# Altium schematic sheet PCL-03.SchDoc
size Tabloid; SheetNumber: 3; SheetTotal: 4
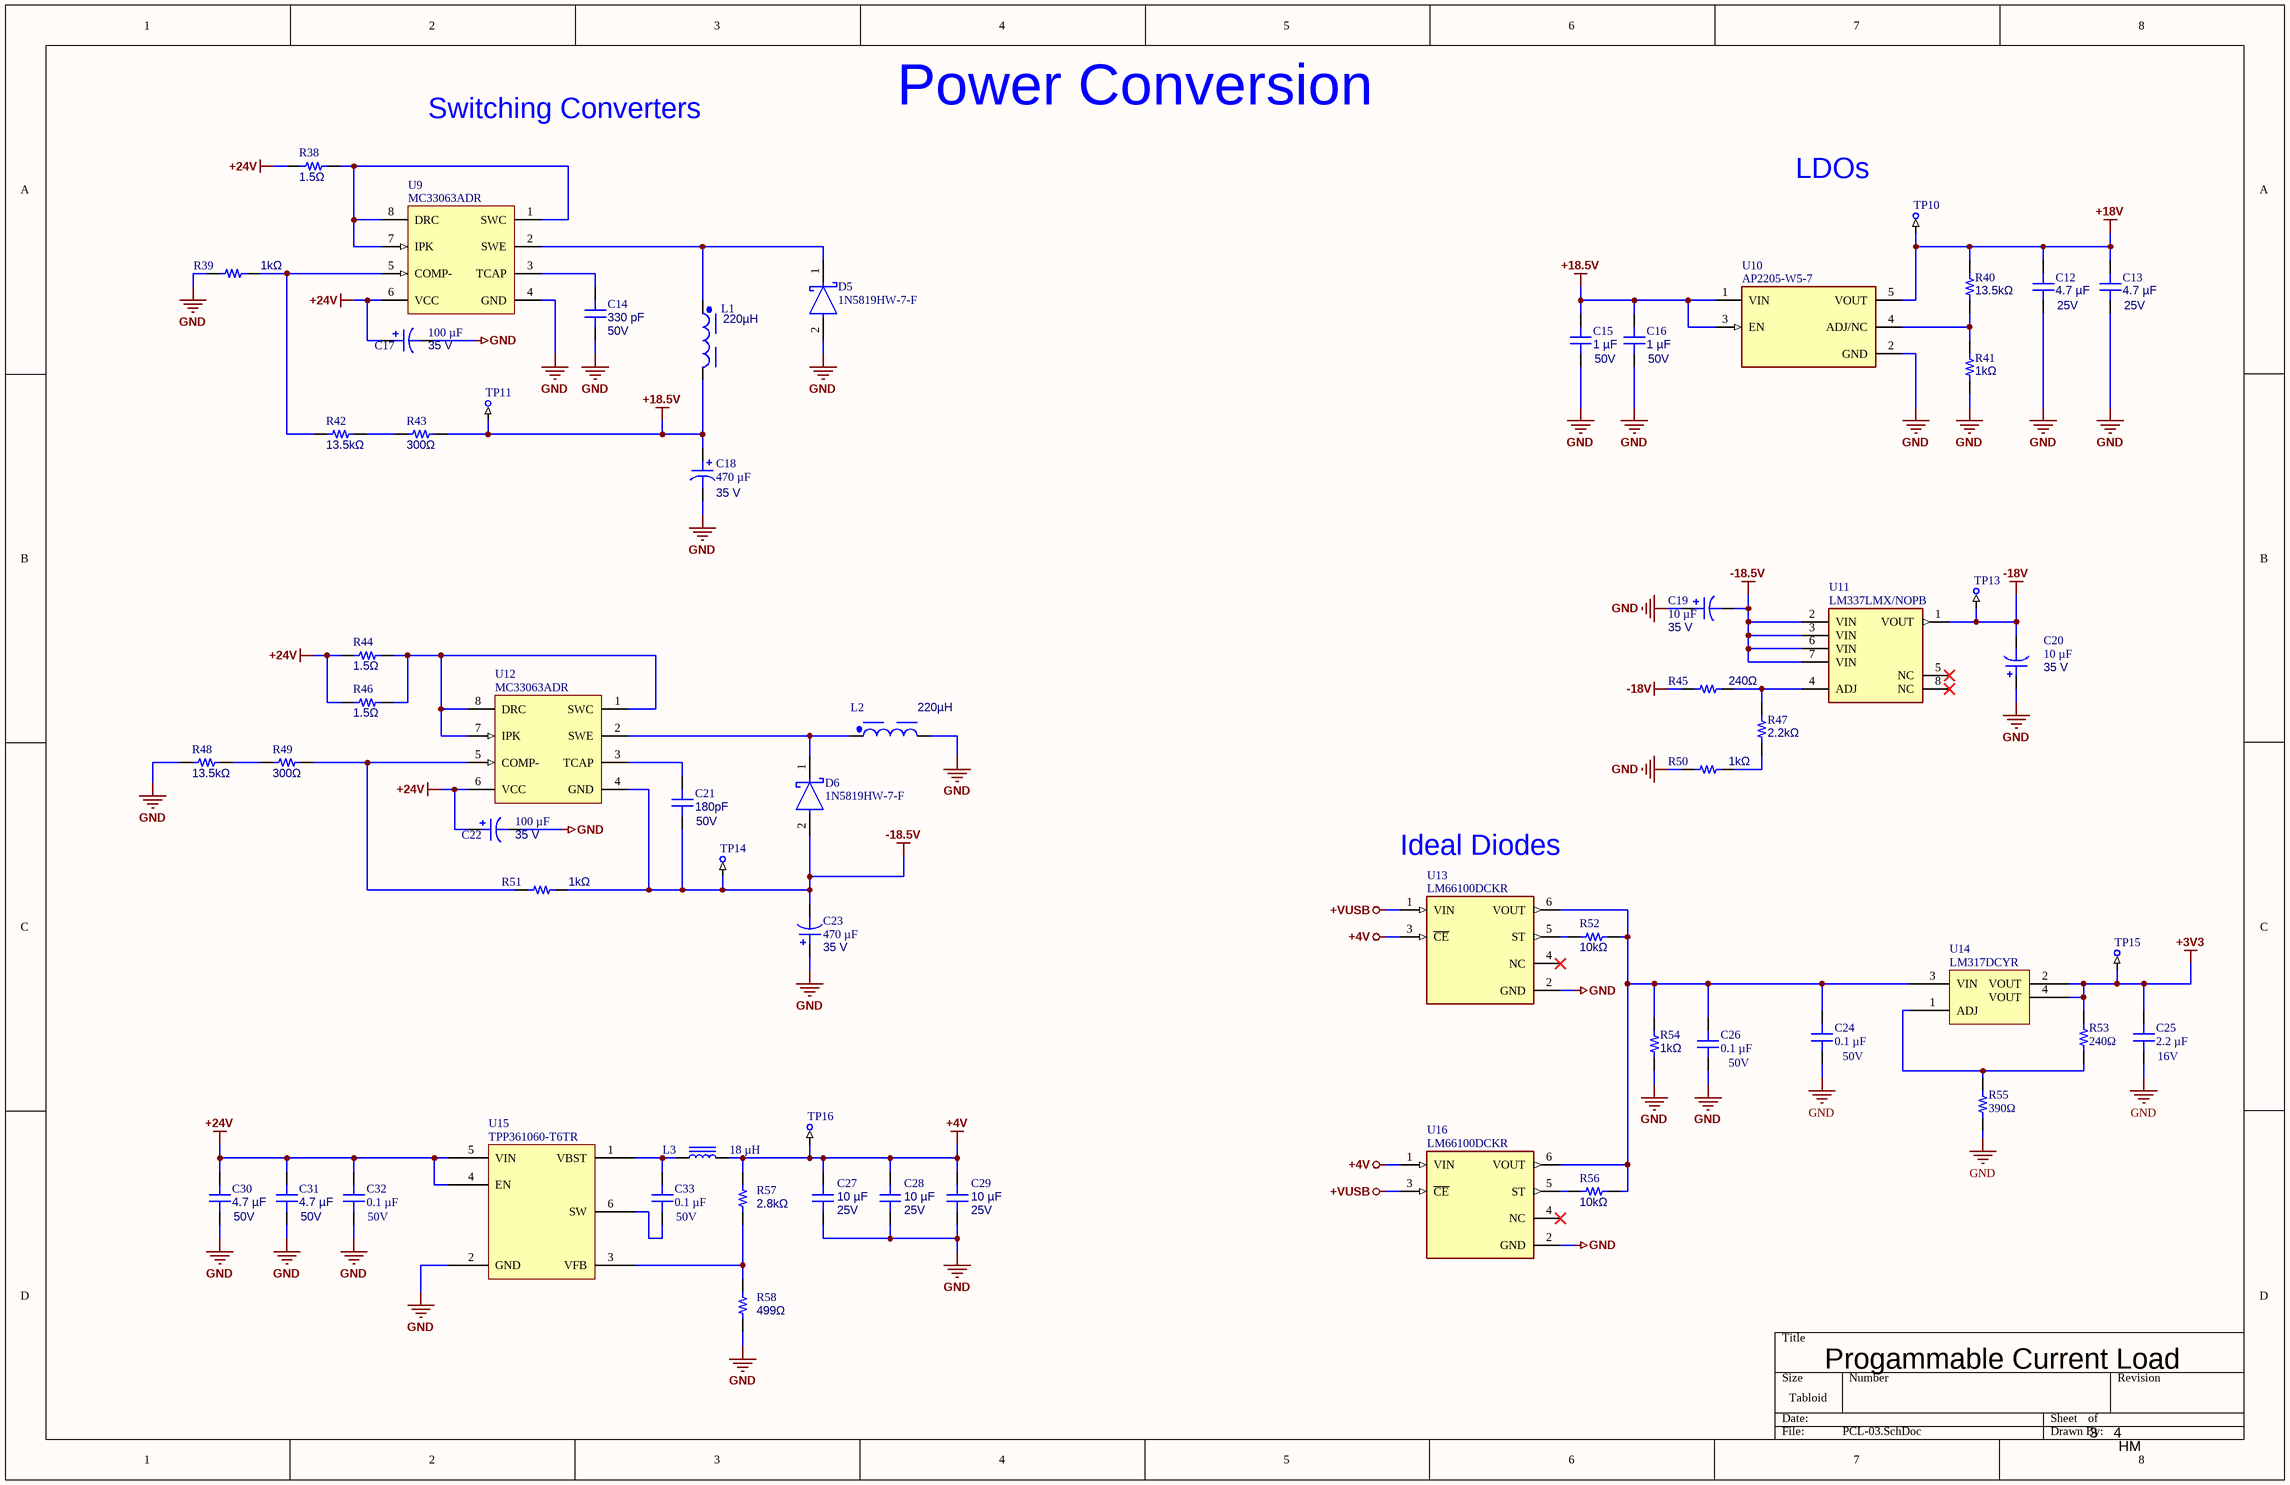
[diagram p0: PCL-03.SchDoc]

## Parts
C12  Voltage - Rated: 25V  [CAP 0805_2012]  (hidden comment: 4.7 µF)
C13  Voltage - Rated: 25V  [CAP 0805_2012]  (hidden comment: 4.7 µF)
C14  Voltage - Rated: 50V  [CAP 0603_1608]  (hidden comment: 330 pF)
C15  Voltage - Rated: 50V  [CAP 0805_2012]  (hidden comment: 1 µF)
C16  Voltage - Rated: 50V  [CAP 0805_2012]  (hidden comment: 1 µF)
C17  100 µF  Voltage - Rated: 35 V  [CAP ALSMD 8.3MM H10.5MM]
C18  470 µF  Voltage - Rated: 35 V  [CAP ALSMD 8.3MM H10.5MM]
C19  10 µF  Voltage - Rated: 35 V  [CAP ALSMD 4.3MM H5.4MM]
C20  10 µF  Voltage - Rated: 35 V  [CAP ALSMD 4.3MM H5.4MM]
C21  Voltage - Rated: 50V  [CAP 0603_1608]  (hidden comment: 180pF)
C22  100 µF  Voltage - Rated: 35 V  [CAP ALSMD 8.3MM H10.5MM]
C23  470 µF  Voltage - Rated: 35 V  [CAP ALSMD 8.3MM H10.5MM]
C24  Voltage - Rated: 50V  [CAP 0603_1608]  (hidden comment: 0.1 µF)
C25  Voltage - Rated: 16V  [CAP 0603_1608]  (hidden comment: 2.2 µF)
C26  Voltage - Rated: 50V  [CAP 0603_1608]  (hidden comment: 0.1 µF)
C27  Voltage - Rated: 25V  [CAP 0805_2012]  (hidden comment: 10 µF)
C28  Voltage - Rated: 25V  [CAP 0805_2012]  (hidden comment: 10 µF)
C29  Voltage - Rated: 25V  [CAP 0805_2012]  (hidden comment: 10 µF)
C30  Voltage - Rated: 50V  [CAP 1206_3216 - 0.8MM]  (hidden comment: 4.7 µF)
C31  Voltage - Rated: 50V  [CAP 1206_3216 - 0.8MM]  (hidden comment: 4.7 µF)
C32  Voltage - Rated: 50V  [CAP 0603_1608]  (hidden comment: 0.1 µF)
C33  Voltage - Rated: 50V  [CAP 0603_1608]  (hidden comment: 0.1 µF)
D5  1N5819HW-7-F  [FP-SOD123-IPC_A]
D6  1N5819HW-7-F  [FP-SOD123-IPC_A]
L1  Inductance: 220µH  [WE-PD_1260P]  (hidden comment: 7447706221)
L2  Inductance: 220µH  [WE-PD_1260P]  (hidden comment: 7447706221)
L3  18 µH  [BOURNS SRR6028]
R38  1.5Ω  [RES 0603_1608]
R39  1kΩ  [RES 0603_1608]
R40  13.5kΩ  [RES 0603_1608]
R41  1kΩ  [RES 0603_1608]
R42  13.5kΩ  [RES 0603_1608]
R43  300Ω  [RES 0603_1608]
R44  1.5Ω  [RES 0603_1608]
R45  240Ω  [RES 0603_1608]
R46  1.5Ω  [RES 0603_1608]
R47  2.2kΩ  [RES 0603_1608]
R48  13.5kΩ  [RES 0603_1608]
R49  300Ω  [RES 0603_1608]
R50  1kΩ  [RES 0603_1608]
R51  1kΩ  [RES 0603_1608]
R52  10kΩ  [RES 0603_1608]
R53  240Ω  [RES 0603_1608]
R54  1kΩ  [RES 0603_1608]
R55  390Ω  [RES 0603_1608]
R56  10kΩ  [RES 0603_1608]
R57  2.8kΩ  [RES 0603_1608]
R58  499Ω  [RES 0603_1608]
TP10  5016  [KEYSTONE-5016_V]  (value not drawn)
TP11  5016  [KEYSTONE-5016_V]  (value not drawn)
TP13  5016  [KEYSTONE-5016_V]  (value not drawn)
TP14  5016  [KEYSTONE-5016_V]  (value not drawn)
TP15  5016  [KEYSTONE-5016_V]  (value not drawn)
TP16  5016  [KEYSTONE-5016_V]  (value not drawn)
U9  MC33063ADR  [D0008A_M]
U10  AP2205-W5-7  [FP-SOT25-IPC_B]
U11  LM337LMX/NOPB  [FP-D0008A-MFG]
U12  MC33063ADR  [D0008A_M]
U13  LM66100DCKR  [SOT65P210X110-6N]
U14  LM317DCYR  [TI SOT-223 DCY]
U15  TPP361060-T6TR  [3PEAK TSOT23-6-A T6T]
U16  LM66100DCKR  [SOT65P210X110-6N]

## Nets
+3V3: C25.2 R53.2 TP15.1 U14.2(VOUT) U14.4(VOUT)
+4V: C27.2 C28.2 C29.2 L3.2 R57.2 TP16.1 U13.3(~{CE}) U16.1(VIN)
+18.5V: C15.2 C16.2 C18.1 L1.2 R43.2 TP11.1 U10.1(VIN) U10.3(EN)
+18V: C12.2 C13.2 R40.1 TP10.1 U10.5(VOUT)
+24V: C17.1 C22.1 C30.2 C31.2 C32.2 R38.1 R44.1 R46.1 U9.6(VCC) U12.6(VCC) U15.4(EN) U15.5(VIN)
+VUSB: U13.1(VIN) U16.3(~{CE})
-18.5V: C19.2 C21.1 C23.2 D6.2(A) R51.2 TP14.1 U11.2(VIN) U11.3(VIN) U11.6(VIN) U11.7(VIN) U12.4(GND)
-18V: C20.2 R45.1 TP13.1 U11.1(VOUT)
GND: C12.1 C13.1 C14.2 C15.1 C16.1 C17.2 C18.2 C19.1 C20.1 C22.2 C23.1 C24.1 C25.1 C26.1 C27.1 C28.1 C29.1 C30.1 C31.1 C32.1 D5.2(A) L2.2 R39.1 R41.2 R48.1 R50.1 R54.1 R55.1 R58.1 U9.4(GND) U10.2(GND) U13.2(GND) U15.2(GND) U16.2(GND)
NetC14_1: C14.1 U9.3(TCAP)
NetC21_2: C21.2 U12.3(TCAP)
NetC24_2: C24.2 C26.2 R52.2 R54.2 R56.2 U13.6(VOUT) U14.3(VIN) U16.6(VOUT)
NetC33_1: C33.1 U15.6(SW)
NetC33_2: C33.2 L3.1 U15.1(VBST)
NetD5_1: D5.1(C) L1.1 U9.2(SWE)
NetD6_1: D6.1(C) L2.1 U12.2(SWE)
NetR38_2: R38.2 U9.1(SWC) U9.7(IPK) U9.8(DRC)
NetR39_2: R39.2 R42.1 U9.5(COMP-)
NetR40_2: R40.2 R41.1 U10.4(ADJ/NC)
NetR42_2: R42.2 R43.1
NetR44_2: R44.2 R46.2 U12.1(SWC) U12.7(IPK) U12.8(DRC)
NetR45_2: R45.2 R47.2 U11.4(ADJ)
NetR47_1: R47.1 R50.2
NetR48_2: R48.2 R49.1
NetR49_2: R49.2 R51.1 U12.5(COMP-)
NetR52_1: R52.1 U13.5(ST)
NetR53_1: R53.1 R55.2 U14.1(ADJ)
NetR56_1: R56.1 U16.5(ST)
NetR57_1: R57.1 R58.2 U15.3(VFB)

Not connected (* = marked no-connect by the designer): U11 5(NC)* 8(NC)*; U13 4(NC)*; U16 4(NC)*

## Notes on the sheet
- Switching Converters
- Power Conversion
- LDOs
- Ideal Diodes
- Progammable Current Load
- 3
- 4
- HM

## Library data of the parts
C12 C13 = 0805X475K250CT: CAP CER 4.7UF 25V X5R 0805; manufacturer: Walsin Technology Corporation; Tolerance: ±10%; Part Number: 0805X475K250CT; Capacitance: 4.7 µF; Applications: General Purpose; componentlink1description: Datasheet; componentlink1url: https://www.passivecomponent.com/wp-content/uploads/datasheet/WTC_MLCC_General_Purpose.pdf; componentlink2description: DigiKey Link; componentlink2url: https://www.digikey.com/en/products/detail/walsin-technology-corporation/0805X475K250CT/14836837; Device Package: 0805 (2012 Metric); lastupdated: 2026-04-06 7:32:06 PM; Lifecycle Status: Active; Minimum Order: 1; Mounting Type: Surface Mount, MLCC; Operating Temperature: -55°C ~ 85°C; Package / Case: 0805 (2012 Metric); packaging: TapeAndReel; partid: 33404; Part Status: Active; price: 0.03; series: -; Size / Dimension: 0.079" L x 0.049" W (2.00mm x 1.25mm); Supplier 1: DigiKey; Supplier Part Number 1: 1292-0805X475K250CT-ND; Temperature Coefficient: X5R; Thickness (Max): 0.057" (1.45mm); value: 4.7 µF
C14 = AC0603JRNPO9BN331: CAP CER 330PF 50V C0G/NPO 0603; manufacturer: Yageo; Temperature Coefficient: C0G, NP0; Tolerance: ±5%; Part Number: AC0603JRNPO9BN331; Capacitance: 330 pF; Applications: Automotive; componentlink1description: Datasheet; componentlink1url: http://www.yageo.com/NewPortal/_en/search/productDocs.jsp?YageoPartNumber=AC0603JRNPO9BN331; componentlink2description: DigiKey Link; componentlink2url: https://www.digikey.com/en/products/detail/yageo/AC0603JRNPO9BN331/6643266; Device Package: 0603 (1608 Metric); lastupdated: 2026-04-06 7:23:52 PM; Lifecycle Status: Active; Minimum Order: 1; Mounting Type: Surface Mount, MLCC; Operating Temperature: -55°C ~ 125°C; Package / Case: 0603 (1608 Metric); packaging: TapeAndReel; partid: 2321; Part Status: Active; price: 0.01; Ratings: AEC-Q200; series: AC; Size / Dimension: 0.063" L x 0.031" W (1.60mm x 0.80mm); Supplier 1: DigiKey; Supplier Part Number 1: 311-3280-1-ND; Thickness (Max): 0.035" (0.90mm); value: 330 pF
C15 C16 = 0805B105K500CT: CAP CER 1UF 50V X7R 0805; manufacturer: Walsin Technology Corporation; Tolerance: ±10%; Part Number: 0805B105K500CT; Capacitance: 1 µF; Applications: General Purpose; componentlink1description: Datasheet; componentlink1url: https://www.passivecomponent.com/wp-content/uploads/datasheet/WTC_MLCC_General_Purpose.pdf; componentlink2description: DigiKey Link; componentlink2url: https://www.digikey.com/en/products/detail/walsin-technology-corporation/0805B105K500CT/14836864; Device Package: 0805 (2012 Metric); lastupdated: 2026-04-06 7:31:50 PM; Lifecycle Status: Active; Minimum Order: 1; Mounting Type: Surface Mount, MLCC; Operating Temperature: -55°C ~ 125°C; Package / Case: 0805 (2012 Metric); packaging: TapeAndReel; partid: 41252; Part Status: Active; price: 0.01; series: -; Size / Dimension: 0.079" L x 0.049" W (2.00mm x 1.25mm); Supplier 1: DigiKey; Supplier Part Number 1: 1292-0805B105K500CT-ND; Temperature Coefficient: X7R; Thickness (Max): 0.057" (1.45mm); value: 1 µF
C17 C22 = UCD1V101MNL1GS: CAP ALUM 100UF 20% 35V SMD; manufacturer: Nichicon; Impedance: 160 mOhms; Lifetime @ Temp.: 5000 Hrs @ 105°C; Polarization: Polar; Ripple Current @ High Frequency: 600 mA @ 100 kHz; Ripple Current @ Low Frequency: 300 mA @ 120 Hz; Surface Mount Land Size: 0.327" L x 0.327" W (8.30mm x 8.30mm); Part Number: UCD1V101MNL1GS; Applications: Automotive; Capacitance: 100 µF; componentlink1description: Datasheet; componentlink1url: http://nichicon-us.com/english/products/pdfs/e-ucd.pdf; componentlink2description: DigiKey Link; componentlink2url: https://www.digikey.com/en/products/detail/nichicon/UCD1V101MNL1GS/3439293; Device Package: Radial, Can - SMD; Height - Seated (Max): 0.413" (10.50mm); lastupdated: 2026-04-05 8:53:58 PM; Lifecycle Status: Active; Minimum Order: 1; Mounting Type: Surface Mount; Operating Temperature: -55°C ~ 105°C; Package / Case: Radial, Can - SMD; packaging: TapeAndReel; partid: 7455; Part Status: Active; price: 0.14; Ratings: AEC-Q200; series: UCD; Size / Dimension: 0.315" Dia (8.00mm); Supplier 1: DigiKey; Supplier Part Number 1: 493-6186-1-ND; Tolerance: ±20%; value: 100 µF
C18 C23 = UCV1V471MNL1GS: CAP ALUM 470UF 20% 35V SMD; manufacturer: Nichicon; Impedance: 80 mOhms; Lifetime @ Temp.: 2000 Hrs @ 105°C; Polarization: Polar; Ripple Current @ High Frequency: 850 mA @ 100 kHz; Ripple Current @ Low Frequency: 425 mA @ 120 Hz; Surface Mount Land Size: 0.327" L x 0.327" W (8.30mm x 8.30mm); Part Number: UCV1V471MNL1GS; Applications: General Purpose; Capacitance: 470 µF; componentlink1description: Datasheet; componentlink1url: http://nichicon-us.com/english/products/pdfs/e-ucv.pdf; componentlink2description: DigiKey Link; componentlink2url: https://www.digikey.com/en/products/detail/nichicon/UCV1V471MNL1GS/5724335; Device Package: Radial, Can - SMD; Height - Seated (Max): 0.413" (10.50mm); lastupdated: 2026-04-05 8:53:55 PM; Lifecycle Status: Active; Minimum Order: 1; Mounting Type: Surface Mount; Operating Temperature: -55°C ~ 105°C; Package / Case: Radial, Can - SMD; packaging: TapeAndReel; partid: 27851; Part Status: Active; price: 0.38; Ratings: AEC-Q200; series: UCV; Size / Dimension: 0.315" Dia (8.00mm); Supplier 1: DigiKey; Supplier Part Number 1: 493-14356-1-ND; Tolerance: ±20%; value: 470 µF
C19 C20 = 865080540004: CAP ALUM 10UF 20% 35V SMD; manufacturer: Würth Elektronik; Impedance: 2 Ohms; Lifetime @ Temp.: 2000 Hrs @ 105°C; Polarization: Polar; Ripple Current @ High Frequency: 90 mA @ 100 kHz; Ripple Current @ Low Frequency: 53.1 mA @ 120 Hz; Surface Mount Land Size: 0.169" L x 0.169" W (4.30mm x 4.30mm); Part Number: 865080540004; Applications: General Purpose; Capacitance: 10 µF; componentlink1description: Datasheet; componentlink1url: https://katalog.we-online.de/pbs/datasheet/865080540004.pdf; componentlink2description: DigiKey Link; componentlink2url: https://www.digikey.com/en/products/detail/würth-elektronik/865080540004/5728098; Device Package: Radial, Can - SMD; Height - Seated (Max): 0.217" (5.50mm); lastupdated: 2026-04-05 8:29:50 PM; Lifecycle Status: Active; Minimum Order: 1; Mounting Type: Surface Mount; Operating Temperature: -55°C ~ 105°C; Package / Case: Radial, Can - SMD; packaging: TapeAndReel; partid: 7376; Part Status: Active; price: 0.10; series: WCAP-ASLI; Size / Dimension: 0.157" Dia (4.00mm); Supplier 1: DigiKey; Supplier Part Number 1: 732-8503-1-ND; Tolerance: ±20%; value: 10 µF
C21 = 06035A181FAT2A: CAP CER 180PF 50V C0G/NP0 0603; manufacturer: AVX Corporation; Temperature Coefficient: C0G, NP0; Tolerance: ±1%; Part Number: 06035A181FAT2A; Capacitance: 180pF; Applications: General Purpose; componentlink1description: Datasheet; componentlink1url: http://datasheets.avx.com/C0GNP0-Dielectric.pdf; componentlink2description: DigiKey Link; componentlink2url: http://digikey.com/product-detail/en/avx-corporation/06035A181FAT2A/478-6029-1-ND/2208943; Device Package: 0603 (1608 Metric); lastupdated: 2020-09-02 1:03:35 AM; Lifecycle Status: Active; Minimum Order: 1; Mounting Type: Surface Mount, MLCC; Operating Temperature: -55°C ~ 125°C; Package / Case: 0603 (1608 Metric); packaging: TapeAndReel; partid: 2669; Part Status: Active; price: 0.11; series: -; Size / Dimension: 0.063" L x 0.032" W (1.60mm x 0.81mm); Supplier 1: DigiKey; Supplier Part Number 1: 478-6029-1-ND; Thickness (Max): 0.035" (0.90mm); value: 180pF
C24 C26 C32 C33 = C0603C104K5RAC7411: CAP CER 0.1UF 50V X7R 0603; manufacturer: KEMET; Tolerance: ±10%; Part Number: C0603C104K5RAC7411; Capacitance: 0.1 µF; Applications: Bypass, Decoupling; componentlink1description: Datasheet; componentlink1url: https://api.kemet.com/component-edge/download/datasheet/C0603C104K5RAC7411.pdf; componentlink2description: DigiKey Link; componentlink2url: https://www.digikey.com/en/products/detail/kemet/C0603C104K5RAC7411/3317013; Device Package: 0603 (1608 Metric); lastupdated: 2026-04-06 7:23:52 PM; Lifecycle Status: Active; Minimum Order: 1; Mounting Type: Surface Mount, MLCC; Operating Temperature: -55°C ~ 125°C; Package / Case: 0603 (1608 Metric); packaging: TapeAndReel; partid: 2233; Part Status: Active; price: 0.01; series: SMD Comm X7R; Size / Dimension: 0.063" L x 0.031" W (1.60mm x 0.80mm); Supplier 1: DigiKey; Supplier Part Number 1: 399-C0603C104K5RAC7411CT-ND; Temperature Coefficient: X7R; Thickness (Max): 0.035" (0.90mm); value: 0.1 µF
C25 = CC0603ZRY5V7BB225: CAP CER 2.2UF 16V Y5V 0603; manufacturer: Yageo; Temperature Coefficient: Y5V (F); Tolerance: -20%, +80%; Part Number: CC0603ZRY5V7BB225; Capacitance: 2.2 µF; Applications: General Purpose; componentlink1description: Datasheet; componentlink1url: http://www.yageo.com/documents/recent/UPY-GPHC_Y5V_6.3V-to-50V_8.pdf; componentlink2description: DigiKey Link; componentlink2url: https://www.digikey.com/en/products/detail/yageo/CC0603ZRY5V7BB225/5883851; Device Package: 0603 (1608 Metric); lastupdated: 2026-04-06 7:23:53 PM; Lifecycle Status: Active; Minimum Order: 1; Mounting Type: Surface Mount, MLCC; Operating Temperature: -30°C ~ 85°C; Package / Case: 0603 (1608 Metric); packaging: TapeAndReel; partid: 2203; Part Status: Active; price: 0.01; series: CC; Size / Dimension: 0.063" L x 0.031" W (1.60mm x 0.80mm); Supplier 1: DigiKey; Supplier Part Number 1: 311-3416-1-ND; Thickness (Max): 0.035" (0.90mm); value: 2.2 µF
C27-C29 = 0805X106K250CT: CAP CER 10UF 25V X5R 0805; manufacturer: Walsin Technology Corporation; Tolerance: ±10%; Part Number: 0805X106K250CT; Capacitance: 10 µF; Applications: General Purpose; componentlink1description: Datasheet; componentlink1url: https://www.passivecomponent.com/wp-content/uploads/datasheet/WTC_MLCC_General_Purpose.pdf; componentlink2description: DigiKey Link; componentlink2url: https://www.digikey.com/en/products/detail/walsin-technology-corporation/0805X106K250CT/14836836; Device Package: 0805 (2012 Metric); lastupdated: 2026-04-06 7:31:50 PM; Lifecycle Status: Active; Minimum Order: 1; Mounting Type: Surface Mount, MLCC; Operating Temperature: -55°C ~ 85°C; Package / Case: 0805 (2012 Metric); packaging: TapeAndReel; partid: 41243; Part Status: Active; price: 0.01; series: -; Size / Dimension: 0.079" L x 0.049" W (2.00mm x 1.25mm); Supplier 1: DigiKey; Supplier Part Number 1: 1292-0805X106K250CT-ND; Temperature Coefficient: X5R; Thickness (Max): 0.057" (1.45mm); value: 10 µF
C30 C31 = UMK316ABJ475KD-T: CAP CER 4.7UF 50V X5R 1206; manufacturer: Taiyo Yuden; Tolerance: ±10%; Part Number: UMK316ABJ475KD-T; Capacitance: 4.7 µF; Applications: SMPS Filtering; componentlink1description: Datasheet; componentlink1url: https://www.yuden.co.jp/productdata/catalog/mlcc01_e.pdf; componentlink2description: DigiKey Link; componentlink2url: https://www.digikey.com/en/products/detail/taiyo-yuden/UMK316ABJ475KD-T/2714166; Device Package: 1206 (3216 Metric); lastupdated: 2026-04-06 7:38:00 PM; Lifecycle Status: Active; Minimum Order: 1; Mounting Type: Surface Mount, MLCC; Operating Temperature: -55°C ~ 85°C; Package / Case: 1206 (3216 Metric); packaging: TapeAndReel; partid: 18934; Part Status: Active; price: 0.08; series: M; Size / Dimension: 0.126" L x 0.063" W (3.20mm x 1.60mm); Supplier 1: DigiKey; Supplier Part Number 1: 587-2988-1-ND; Temperature Coefficient: X5R; Thickness (Max): 0.037" (0.95mm); value: 4.7 µF
D5 D6 = CMP-0303-00003-3: DIODE SCHOTTKY 40V 1A SOD123; Forward Voltage: 450mV; Capacitance: 110pF; Max Forward Surge Current (Ifsm): 25A; Peak Reverse Current: 50uA; Polarity: Standard; Element Configuration: Single; Max Power Dissipation: 450mW; Min Operating Temperature: -65°C; Package Quantity: 3000; Contact Plating: Tin; Weight: 0.000353oz; Max Repetitive Reverse Voltage (Vrrm): 40V; Max Reverse Voltage (DC): 40V; Height: 1.25mm; Average Rectified Current: 1A; Width: 1.7mm; Case/Package: SOD-123-2; Lead Free: Lead Free; Max Operating Temperature: 125°C; Current Rating: 1A; Termination: SMD/SMT; Forward Current: 1A; Radiation Hardening: No; Number of Pins: 2; Length: 2.85mm; Voltage Rating (DC): 40V; REACH SVHC: No SVHC; Peak Non-Repetitive Surge Current: 25A; Packaging: Tape and Reel; Output Current: 1A
L1 L2 = CMP-03913-107343608-2: Inductor, Aec-Q200, 220Uh, Shld, 1.25A Rohs Compliant: Yes; DC Resistance (DCR): 273mΩ; RoHS: Compliant; Min Operating Temperature: -40°C; Height: 6mm; Width: 12mm; Max Operating Temperature: 150°C; Length: 12mm; Ambient Temperature Range Low: -40°C; Ambient Temperature Range High: 110°C; Current Rating: 1.25A
L3 = SRR6028-180Y: FIXED IND 18UH 1.5A 85 MOHM SMD; Manufacturer: Bourns Inc.; Current - Saturation: 1.1A; DC Resistance (DCR): 85mOhm Max; Frequency - Self Resonant: 21MHz; Inductance Frequency - Test: 100 kHz; Material - Core: Ferrite; Q @ Freq: 9 @ 2.52MHz; Shielding: Shielded; Tolerance: ±30%; Type: Drum Core, Wirewound; Part Number: SRR6028-180Y; ComponentLink1Description: Datasheet; ComponentLink1URL: https://www.bourns.com/docs/Product-Datasheets/SRR6028.pdf; ComponentLink2Description: DigiKey Link; ComponentLink2URL: https://www.digikey.com/en/products/detail/bourns-inc/SRR6028-180Y/1970378; Current Rating (Amps): 1.5 A; Device Package: Nonstandard; Height - Seated (Max): 0.118" (3.00mm); Inductance: 18 µH; LastUpdated: 2026-04-05 8:41:45 PM; Lifecycle Status: Active; Minimum Order: 1; Mounting Type: Surface Mount; Operating Temperature: -40°C ~ 125°C; Package / Case: Nonstandard; Packaging: TapeAndReel; PartId: 48; Part Status: Active; Price: 0.28; Series: SRR6028; Size / Dimension: 0.268" L x 0.268" W (6.80mm x 6.80mm); Supplier 1: DigiKey; Supplier Part Number 1: SRR6028-180YCT-ND; Value: 18 µH
R38 R44 R46 = CPF0603B1R5E1: CPF 0603 1R5 0.1% 25PPM 1K RL; Manufacturer: TE Connectivity Passive Product; Power (Watts): 0.063W, 1/16W; Resistance: 1.5 Ohms; Temperature Coefficient: ±25ppm/°C; Part Number: CPF0603B1R5E1; Value: 1.5Ω; ComponentLink1Description: Datasheet; ComponentLink1URL: https://www.te.com/commerce/DocumentDelivery/DDEController?Action=srchrtrv&DocNm=1773200&DocType=DS&DocLang=English; ComponentLink2Description: DigiKey Link; ComponentLink2URL: https://www.digikey.com/en/products/detail/te-connectivity-passive-product/CPF0603B1R5E1/14007095; Composition: Thin Film; Device Package: 0603 (1608 Metric); Height - Seated (Max): 0.022" (0.55mm); LastUpdated: 2024-02-09 8:41:40 PM; Lifecycle Status: Active; Minimum Order: 1; Number of Terminations: 2; Operating Temperature: -55°C ~ 155°C; Package / Case: 0603 (1608 Metric); Packaging: TapeAndReel; PartId: 64169; Part Status: Active; Price: 0.12; Series: CPF; Size / Dimension: 0.061" L x 0.031" W (1.55mm x 0.80mm); Supplier 1: DigiKey; Supplier Part Number 1: 1712-CPF0603B1R5E1CT-ND; Supplier Device Package: 0603; Tolerance: ±0.1%
R39 R41 R50 R51 R54 = CRCW06031K00FKEB: RES SMD 1K OHM 1% 1/10W 0603; Manufacturer: Vishay Dale; Power (Watts): 0.1W, 1/10W; Resistance: 1 kOhms; Temperature Coefficient: ±100ppm/°C; Part Number: CRCW06031K00FKEB; Value: 1kΩ; ComponentLink1Description: Datasheet; ComponentLink1URL: http://www.vishay.com/docs/20035/dcrcwe3.pdf; ComponentLink2Description: DigiKey Link; ComponentLink2URL: https://www.digikey.com/en/products/detail/vishay-dale/CRCW06031K00FKEB/5071169; Composition: Thick Film; Device Package: 0603 (1608 Metric); Features: Automotive AEC-Q200; Height - Seated (Max): 0.020" (0.50mm); LastUpdated: 2024-02-09 8:43:36 PM; Lifecycle Status: Active; Minimum Order: 1; Number of Terminations: 2; Operating Temperature: -55°C ~ 155°C; Package / Case: 0603 (1608 Metric); Packaging: CutTape; PartId: 5123; Part Status: Active; Price: 0.01; Ratings: AEC-Q200; Series: CRCW; Size / Dimension: 0.063" L x 0.033" W (1.60mm x 0.85mm); Supplier 1: DigiKey; Supplier Part Number 1: 541-2985-1-ND; Supplier Device Package: 0603; Tolerance: ±1%
R40 R42 R48 = RT0603BRD0713K5L: RES SMD 13.5KOHM 0.1% 1/10W 0603; Manufacturer: Yageo; Power (Watts): 0.1W, 1/10W; Resistance: 13.5 kOhms; Temperature Coefficient: ±25ppm/°C; Part Number: RT0603BRD0713K5L; Value: 13.5kΩ; ComponentLink1Description: Datasheet; ComponentLink1URL: https://www.yageo.com/upload/media/product/productsearch/datasheet/rchip/PYu-RT_1-to-0.01_RoHS_L_15.pdf; ComponentLink2Description: DigiKey Link; ComponentLink2URL: https://www.digikey.com/en/products/detail/yageo/RT0603BRD0713K5L/5927894; Composition: Thin Film; Device Package: 0603 (1608 Metric); Height - Seated (Max): 0.022" (0.55mm); LastUpdated: 2026-04-06 7:43:21 PM; Lifecycle Status: Active; Minimum Order: 1; Number of Terminations: 2; Operating Temperature: -55°C ~ 155°C; Package / Case: 0603 (1608 Metric); Packaging: TapeAndReel; PartId: 78918; Price: 0.03; Series: RT; Size / Dimension: 0.063" L x 0.031" W (1.60mm x 0.80mm); Supplier 1: DigiKey; Supplier Part Number 1: 13-RT0603BRD0713K5LCT-ND; Supplier Device Package: 0603; Tolerance: ±0.1%
R43 R49 = CPF0603B300RE1: RES SMD 300 OHM 0.1% 1/16W 0603; Manufacturer: TE Connectivity Passive Product; Power (Watts): 0.063W, 1/16W; Resistance: 300 Ohms; Temperature Coefficient: ±25ppm/°C; Part Number: CPF0603B300RE1; Value: 300Ω; ComponentLink1Description: Datasheet; ComponentLink1URL: https://www.te.com/commerce/DocumentDelivery/DDEController?Action=srchrtrv&DocNm=1773200&DocType=DS&DocLang=English; ComponentLink2Description: DigiKey Link; ComponentLink2URL: https://www.digikey.com/en/products/detail/te-connectivity-passive-product/CPF0603B300RE1/2381907; Composition: Thin Film; Device Package: 0603 (1608 Metric); Height - Seated (Max): 0.022" (0.55mm); LastUpdated: 2024-02-09 8:43:16 PM; Lifecycle Status: Active; Minimum Order: 1; Number of Terminations: 2; Operating Temperature: -55°C ~ 155°C; Package / Case: 0603 (1608 Metric); Packaging: TapeAndReel; PartId: 10073; Part Status: Active; Price: 0.12; Series: CPF, Neohm; Size / Dimension: 0.061" L x 0.031" W (1.55mm x 0.80mm); Supplier 1: DigiKey; Supplier Part Number 1: A103081CT-ND; Supplier Device Package: 0603; Tolerance: ±0.1%
R45 = CRCW0603240RFKEA: RES SMD 240 OHM 1% 1/10W 0603; Manufacturer: Vishay Dale; Power (Watts): 0.1W, 1/10W; Resistance: 240 Ohms; Temperature Coefficient: ±100ppm/°C; Part Number: CRCW0603240RFKEA; Value: 240Ω; ComponentLink1Description: Datasheet; ComponentLink1URL: http://www.vishay.com/docs/20035/dcrcwe3.pdf; ComponentLink2Description: DigiKey Link; ComponentLink2URL: https://www.digikey.com/en/products/detail/vishay-dale/CRCW0603240RFKEA/1174595; Composition: Thick Film; Device Package: 0603 (1608 Metric); Features: Automotive AEC-Q200; Height - Seated (Max): 0.020" (0.50mm); LastUpdated: 2024-02-09 8:43:05 PM; Lifecycle Status: Active; Minimum Order: 1; Number of Terminations: 2; Operating Temperature: -55°C ~ 155°C; Package / Case: 0603 (1608 Metric); Packaging: CutTape; PartId: 12672; Part Status: Active; Price: 0.01; Ratings: AEC-Q200; Series: CRCW; Size / Dimension: 0.061" L x 0.033" W (1.55mm x 0.85mm); Supplier 1: DigiKey; Supplier Part Number 1: 541-240HCT-ND; Supplier Device Package: 0603; Tolerance: ±1%
R47 = ERJ-3EKF2201V: RES SMD 2.2K OHM 1% 1/10W 0603; Manufacturer: Panasonic Electronic Components; Power (Watts): 0.1W, 1/10W; Resistance: 2.2 kOhms; Temperature Coefficient: ±100ppm/°C; Part Number: ERJ-3EKF2201V; Value: 2.2kΩ; ComponentLink1Description: Datasheet; ComponentLink1URL: https://industrial.panasonic.com/cdbs/www-data/pdf/RDA0000/AOA0000C304.pdf; ComponentLink2Description: DigiKey Link; ComponentLink2URL: https://www.digikey.com/en/products/detail/panasonic-electronic-components/ERJ-3EKF2201V/1024416; Composition: Thick Film; Device Package: 0603 (1608 Metric); Features: Automotive AEC-Q200; Height - Seated (Max): 0.022" (0.55mm); LastUpdated: 2024-02-09 8:43:34 PM; Lifecycle Status: Active; Minimum Order: 1; Number of Terminations: 2; Operating Temperature: -55°C ~ 155°C; Package / Case: 0603 (1608 Metric); Packaging: TapeAndReel; PartId: 5643; Part Status: Active; Price: 0.01; Ratings: AEC-Q200; Series: ERJ-3EK; Size / Dimension: 0.063" L x 0.031" W (1.60mm x 0.80mm); Supplier 1: DigiKey; Supplier Part Number 1: P2.20KHCT-ND; Supplier Device Package: 0603; Tolerance: ±1%
R52 R56 = RCS060310K0JNEA: RES SMD 10K OHM 5% 1/4W 0603; Manufacturer: Vishay Dale; Power (Watts): 0.25W, 1/4W; Resistance: 10 kOhms; Temperature Coefficient: ±200ppm/°C; Part Number: RCS060310K0JNEA; Value: 10kΩ; ComponentLink1Description: Datasheet; ComponentLink1URL: http://www.vishay.com/docs/20065/rcse3.pdf; ComponentLink2Description: DigiKey Link; ComponentLink2URL: https://www.digikey.com/en/products/detail/vishay-dale/RCS060310K0JNEA/5866963; Composition: Thick Film; Device Package: 0603 (1608 Metric); Features: Automotive AEC-Q200, Pulse Withstanding; Height - Seated (Max): 0.020" (0.50mm); LastUpdated: 2024-02-09 8:43:35 PM; Lifecycle Status: Active; Minimum Order: 1; Number of Terminations: 2; Operating Temperature: -55°C ~ 155°C; Package / Case: 0603 (1608 Metric); Packaging: TapeAndReel; PartId: 5383; Part Status: Active; Price: 0.01; Ratings: AEC-Q200; Series: RCS e3; Size / Dimension: 0.061" L x 0.033" W (1.55mm x 0.85mm); Supplier 1: DigiKey; Supplier Part Number 1: 541-2817-1-ND; Supplier Device Package: 0603; Tolerance: ±5%
R53 = CRCW0603240RFKEA: RES SMD 240 OHM 1% 1/10W 0603; Manufacturer: Vishay Dale; Value: 240 Ohms; Power (Watts): 0.1W, 1/10W; Temperature Coefficient: ±100ppm/°C; Part Number: CRCW0603240RFKEA; ComponentLink1Description: Datasheet; ComponentLink1URL: http://www.vishay.com/docs/20035/dcrcwe3.pdf; ComponentLink2Description: DigiKey Link; ComponentLink2URL: https://www.digikey.com/en/products/detail/vishay-dale/CRCW0603240RFKEA/1174595; Composition: Thick Film; Device Package: 0603 (1608 Metric); Features: Automotive AEC-Q200; Height - Seated (Max): 0.020" (0.50mm); LastUpdated: 2024-02-09 8:43:05 PM; Lifecycle Status: Active; Minimum Order: 1; Number of Terminations: 2; Operating Temperature: -55°C ~ 155°C; Package / Case: 0603 (1608 Metric); Packaging: CutTape; PartId: 12672; Part Status: Active; Price: 0.01; Ratings: AEC-Q200; Resistance: 240 Ohms; Series: CRCW; Size / Dimension: 0.061" L x 0.033" W (1.55mm x 0.85mm); Supplier 1: DigiKey; Supplier Part Number 1: 541-240HCT-ND; Supplier Device Package: 0603; Tolerance: ±1%
R55 = CRGP0603F390R: RES 390 OHM 1% 1/4W 0603; Manufacturer: TE Connectivity Passive Product; Value: 390 Ohms; Power (Watts): 0.25W, 1/4W; Temperature Coefficient: ±100ppm/°C; Part Number: CRGP0603F390R; ComponentLink1Description: Datasheet; ComponentLink1URL: https://www.te.com/commerce/DocumentDelivery/DDEController?Action=srchrtrv&DocNm=9-1773463-9&DocType=DS&DocLang=English; ComponentLink2Description: DigiKey Link; ComponentLink2URL: https://www.digikey.com/en/products/detail/te-connectivity-passive-product/CRGP0603F390R/8577013; Composition: Thick Film; Device Package: 0603 (1608 Metric); Features: Pulse Withstanding; Height - Seated (Max): 0.022" (0.55mm); LastUpdated: 2024-02-09 8:43:36 PM; Lifecycle Status: Active; Minimum Order: 1; Number of Terminations: 2; Operating Temperature: -55°C ~ 155°C; Package / Case: 0603 (1608 Metric); Packaging: TapeAndReel; PartId: 5035; Part Status: Active; Price: 0.02; Resistance: 390 Ohms; Series: CRGP; Size / Dimension: 0.063" L x 0.031" W (1.60mm x 0.80mm); Supplier 1: DigiKey; Supplier Part Number 1: A130411CT-ND; Supplier Device Package: 0603; Tolerance: ±1%
R57 = RT0603BRD072K8L: RES SMD 2.8K OHM 0.1% 1/10W 0603; Manufacturer: Yageo; Power (Watts): 0.1W, 1/10W; Resistance: 2.8 kOhms; Temperature Coefficient: ±25ppm/°C; Part Number: RT0603BRD072K8L; Value: 2.8kΩ; ComponentLink1Description: Datasheet; ComponentLink1URL: https://www.yageo.com/upload/media/product/productsearch/datasheet/rchip/PYu-RT_1-to-0.01_RoHS_L_11.pdf; ComponentLink2Description: DigiKey Link; ComponentLink2URL: https://www.digikey.com/en/products/detail/yageo/RT0603BRD072K8L/1072442; Composition: Thin Film; Device Package: 0603 (1608 Metric); Height - Seated (Max): 0.022" (0.55mm); LastUpdated: 2026-04-06 7:44:00 PM; Lifecycle Status: Active; Minimum Order: 1; Number of Terminations: 2; Operating Temperature: -55°C ~ 155°C; Package / Case: 0603 (1608 Metric); Packaging: TapeAndReel; PartId: 6307; Part Status: Active; Price: 0.03; Series: RT; Size / Dimension: 0.063" L x 0.031" W (1.60mm x 0.80mm); Supplier 1: DigiKey; Supplier Part Number 1: YAG1624CT-ND; Supplier Device Package: 0603; Tolerance: ±0.1%
R58 = ERJ-3EKF4990V: RES SMD 499 OHM 1% 1/10W 0603; Manufacturer: Panasonic Electronic Components; Power (Watts): 0.1W, 1/10W; Resistance: 499 Ohms; Temperature Coefficient: ±100ppm/°C; Part Number: ERJ-3EKF4990V; Value: 499Ω; ComponentLink1Description: Datasheet; ComponentLink1URL: https://industrial.panasonic.com/cdbs/www-data/pdf/RDA0000/AOA0000C304.pdf; ComponentLink2Description: DigiKey Link; ComponentLink2URL: https://www.digikey.com/en/products/detail/panasonic-electronic-components/ERJ-3EKF4990V/196380; Composition: Thick Film; Device Package: 0603 (1608 Metric); Features: Automotive AEC-Q200; Height - Seated (Max): 0.022" (0.55mm); LastUpdated: 2024-02-09 8:43:34 PM; Lifecycle Status: Active; Minimum Order: 1; Number of Terminations: 2; Operating Temperature: -55°C ~ 155°C; Package / Case: 0603 (1608 Metric); Packaging: TapeAndReel; PartId: 5666; Part Status: Active; Price: 0.01; Ratings: AEC-Q200; Series: ERJ-3EK; Size / Dimension: 0.063" L x 0.031" W (1.60mm x 0.80mm); Supplier 1: DigiKey; Supplier Part Number 1: P499HCT-ND; Supplier Device Package: 0603; Tolerance: ±1%
TP10 TP11 TP13-TP16 = CMP-2000-05178-1: Test Point, 1-Pin SMT, RoHS, Tape and Reel; Manufacturer: Keystone; Other Names: 5016KDKR; Featured Product: SurfaceMountTestPoints / 5019MiniatureSurfaceMountTestPoint; Online Catalog: SurfaceMountTestPoints; Catalog Drawings: 5016Top / 5016Side / 5016Front; Packaging: Digi-Reel; RoHS Information: RoHSComplianceStatement; Package Reference: 5016; Mounting Type: SurfaceMount; Type: PCTestPoint,Compact; Manufacturer URL: http://www.keyelco.com/; Standard Package: 1; Package Description: 1-Pin Test Point, Body 3.81 x 2.04 mm; Category: TestandMeasurement; Terminal: 0.015"(0.38mm)PhosphorBronze,SilverPlated; Datasheet URL: https://ciiva.com/datasheet-click-2917613?src=ciiva&sig=4a4e90f; Datasheet Version: Rev. D, 03/2014; Family: TestPoints; Material: PhosphorBronze
U9 U12 = CMP-0323-00192-3: Inverting Buck-Boost Regulator with 3 to 40 V Input and 1.25 to 40 V Output, -40 to 85 degC, 8-Pin SOIC (D), Green (RoHS & no Sb/Br); Manufacturer: Texas Instruments; SubFamily: Step-Down Regulator; Iout(Max)(A): 0.75; Vin(Max)(V): 40; Regulated Outputs(#): 1; Vin(Min)(V): 3; Rating: Catalog; Vout(Min)(V): 1.25; Switch Current Limit(Typ)(A): 1.5; ComponentLink2URL: http://www.ti.com/litv/pdf/msoi002j; Mounting Technology: Surface Mount; ComponentLink2Description: Package Specification; ComponentLink1Description: Datasheet; PartNumber: MC33063ADR; Vout(Max)(V): 40; ComponentLink1URL: http://www.ti.com/general/docs/lit/getliterature.tsp?genericPartNumber=MC33063A&fileType=pdf; Eco-Plan: Green (RoHS & no Sb/Br); PackageVersion: revM, Jun-2011; DatasheetVersion: SLLS636M; PackageDescription: 8-Pin Plastic Small Outline Integrated Circuit, 4.9 x 3.9 mm, Pitch 1.27 mm Pitch; ComponentLink3URL: Samples URL:http://www.ti.com/product/mc33063a#samples; Topology: Inverting Buck-Boost; ComponentLink3Description: URL Link1; Code_JEDEC: MS-012AA; PackageReference: D0008A
U10 = CMP-12756-000046-1: IC REG LIN POS ADJ 250MA SOT25
U11 = CMP-04917-000032-1: IC REG LIN NEG ADJ 100MA 8SOIC; Manufacturer: Texas Instruments; Max Supply Voltage: -4.2V; Output Voltage: -37-1.2V; Max Junction Temp: +125°C; Dropout Voltage: 2200mV; Number Of Outputs: 1; Output Type: AdjustableProgrammable; Standoff Height: 0.11mm; Accuracy Percentage: 1.4%; Min Supply Voltage: -40V; Device Class L1: Integrated Circuits (ICs); Mouser Description: Regulator, Adjustable Negative; SOT-223; -1.2 to -37 V; 0.01 %/V (Typ.; ComponentLink2Description: Datasheet; Lead Free: Yes; Octopart: https://octopart.com/lm337lmx%2Fnopb-texas+instruments-24813736; Temperature: -25°C to +100°C; Height: 1.75mm; Manufacturer Part Number: LM337LMX/NOPB; Device Class L2: Power Management ICs; Temperature Range High: +100°C; RoHS: TRUE; Device Class L3: Voltage Regulators - Linear; Digikey Description: IC REG LIN NEG ADJ 100MA 8SOIC; Output Current: 100mA; Category: IC; Package: D0008A; Automotive: No; Temperature Range Low: -25°C; ComponentLink2URL: http://www.ti.com/lit/ds/symlink/lm337l.pdf
U13 U16 = LM66100DCKR: 1.5-V to 5.5-V, 1.5-A, 0.5-ÂµA IQ ideal diode with integrated FET; MF: Texas Instruments; SnapEDA_Link: https://www.snapeda.com/parts/LM66100DCKR/Texas+Instruments/view-part/?ref=snap; Package: SOT-SC70-6 Texas Instruments; Value: *; MP: LM66100DCKR; Check_prices: https://www.snapeda.com/parts/LM66100DCKR/Texas+Instruments/view-part/?ref=eda
U14 = LM317DCYR: IC REG LIN POS ADJ 1.5A SOT223-4; Manufacturer: Texas Instruments; Number of Regulators: 1; Output Configuration: Positive; Output Type: Adjustable; Protection Features: Over Temperature, Short Circuit; PSRR: 64dB ~ 57dB (120Hz); Voltage - Input (Max): 40V; Voltage - Output (Max): 37V; Voltage - Output (Min/Fixed): 1.25V; Part Number: LM317DCYR; ComponentLink1Description: Datasheet; ComponentLink1URL: http://www.ti.com/general/docs/suppproductinfo.tsp?distId=10&gotoUrl=http%3A%2F%2Fwww.ti.com%2Flit%2Fgpn%2Flm317; ComponentLink2Description: DigiKey Link; ComponentLink2URL: //digikey.com/product-detail/en/texas-instruments/LM317DCYR/296-12602-2-ND/443739; Current - Output: 1.5A; Device Package: TO-261-4, TO-261AA; LastUpdated: 2019-12-09 2:53:08 PM; Lifecycle Status: 0; Minimum Order: 1; Mounting Type: Surface Mount; Operating Temperature: 0°C ~ 125°C; Package / Case: TO-261-4, TO-261AA; Packaging: TapeAndReel; Part Status: Active; Price: 0.28; Series: -; Supplier 1: DigiKey; Supplier Part Number 1: 296-12602-2-ND; Supplier Device Package: SOT-223-4
U15 = TPP361060-T6TR: IC REG BUCK ADJ 1A TSOT23-6; Manufacturer: 3PEAK; Frequency - Switching: 500kHz; Function: Step-Down; Number of Outputs: 1; Output Configuration: Positive; Output Type: Adjustable; Synchronous Rectifier: Yes; Voltage - Input (Max): 36V; Voltage - Input (Min): 4.5V; Voltage - Output (Min/Fixed): 0.6V; Part Number: TPP361060-T6TR; ComponentLink1Description: Datasheet; ComponentLink1URL: https://file.3peakic.com.cn:8080/product/Datasheet_TPP36106.pdf; ComponentLink2Description: DigiKey Link; ComponentLink2URL: https://www.digikey.com/en/products/detail/3peak/TPP361060-T6TR/22228294; Current - Output: 1A; LastUpdated: 2025-07-28 2:05:04 PM; Lifecycle Status: Active; Minimum Order: 1; Mounting Type: Surface Mount; Operating Temperature: -40°C ~ 125°C (TA); Packaging: TapeAndReel; Price: 0.12; Series: -; Supplier 1: DigiKey; Supplier Part Number 1: 5503-TPP361060-T6TRCT-ND; Supplier Device Package: TSOT-23-6; Topology: Buck; Voltage - Output (Max): 36V